# Altium schematic sheet MOSFETs.SchDoc
size B; SheetNumber: 2; SheetTotal: 4
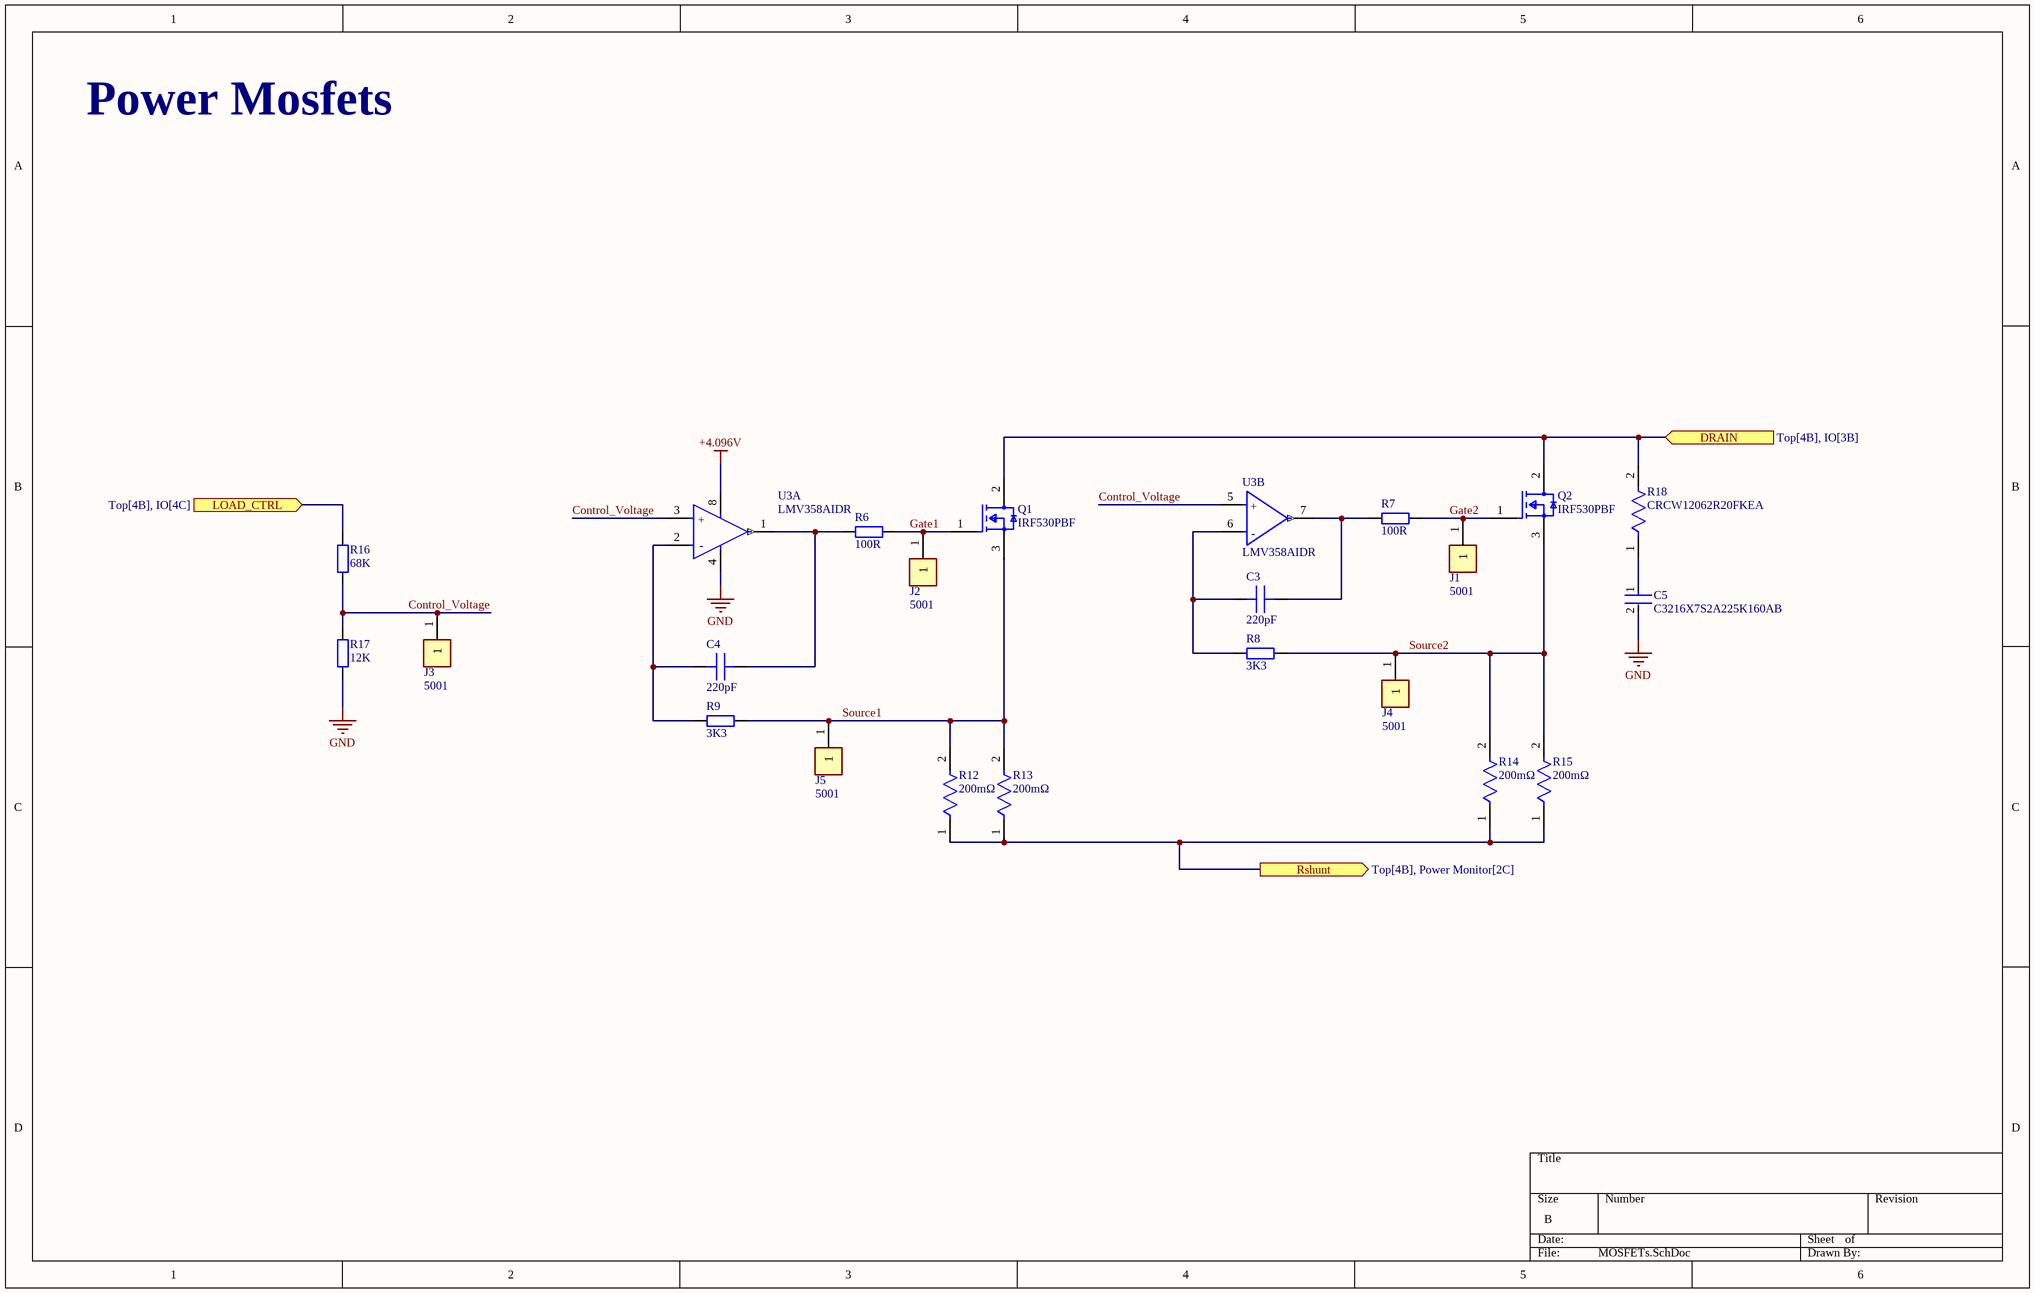
[diagram p0: MOSFETs.SchDoc]

## Parts
C3  220pF  [IPC C C0603 NO SILK]
C4  220pF  [IPC C C0603 NO SILK]
C5  C3216X7S2A225K160AB  [FP-C3216-160-0_2-IPC_B]
J1  5001  [FP-5001-MFG]
J2  5001  [FP-5001-MFG]
J3  5001  [FP-5001-MFG]
J4  5001  [FP-5001-MFG]
J5  5001  [FP-5001-MFG]
Q1  IRF530PBF  [FP-X15-0364-MFG]
Q2  IRF530PBF  [FP-X15-0364-MFG]
R6  100R  [IPC C R0603 NO SILK]
R7  100R  [IPC C R0603 NO SILK]
R8  3K3  [IPC C R0603 NO SILK]
R9  3K3  [IPC C R0603 NO SILK]
R12  200mΩ  [FP-RL2512-MFG]
R13  200mΩ  [FP-RL2512-MFG]
R14  200mΩ  [FP-RL2512-MFG]
R15  200mΩ  [FP-RL2512-MFG]
R16  68K  [IPC C R0603 NO SILK]
R17  12K  [IPC C R0603 NO SILK]
R18  CRCW12062R20FKEA  [FP-CRCW1206-e3-IPC_A]
U3  LMV358AIDR  [FP-D0008A-IPC_C]  (parts A,B of 2)

## Ports
DRAIN (in, see Top[4B], IO[3B]), LOAD_CTRL (in, see Top[4B], IO[4C]), Rshunt (out, see Top[4B], Power Monitor[2C])

## Nets
+4.096V: U3.8(V+)
GND: C5.2 R17.1 U3.4(V-)
Control_Voltage: J3.1 R16.1 R17.2 U3.3(+IN_A) U3.5(+IN_B)
DRAIN: Q1.2(D) Q2.2(D) R18.2 ; port DRAIN
Gate1: J2.1 Q1.1(G) R6.2
Gate2: J1.1 Q2.1(G) R7.2
LOAD_CTRL: R16.2 ; port LOAD_CTRL
Rshunt: R12.1 R13.1 R14.1 R15.1 ; port Rshunt
Source1: J5.1 Q1.3(S) R9.2 R12.2 R13.2
Source2: J4.1 Q2.3(S) R8.2 R14.2 R15.2
NetC3_1: C3.1 R8.1 U3.6(-IN_B)
NetC3_2: C3.2 R7.1 U3.7(OUT_B)
NetC4_1: C4.1 R9.1 U3.2(-IN_A)
NetC4_2: C4.2 R6.1 U3.1(OUT_A)
NetC5_1: C5.1 R18.1

## Notes on the sheet
- Power Mosfets
- (in symbol CMP-04895-000233-1, part A) +; -
- (in symbol CMP-04895-000233-1, part B) +; -

## Library data of the parts
C3 C4 = CMP-002-000001-1: Generic CAP 0603; Value: 220pF; Source: Schlib1.SchLib; Design Item ID: Generic CAP 0603
C5 = CMP-08246-004303-1: Multilayer Ceramic Capacitors 2.2uF ±10% 100V X7S SMD 1206; Min Operating Temperature: -55°C; Tolerance: 10%; Number of Pins: 2; Case Code (Metric): 3216; REACH SVHC: No SVHC; Package Quantity: 1; Capacitance: 2.2uF; Lead Free: Lead Free; Termination: SMD/SMT; Voltage Rating (DC): 100V; Voltage Rating: 100V; Case Code (Imperial): 1206; Dielectric: X7S; Height: 1.6mm; Packaging: Tape and Reel; Weight: 0.000571oz; Radiation Hardening: No; Mount: Surface Mount; Width: 0.063inch; Length: 3.2mm; Case/Package: 1206; Depth: 1.6mm; RoHS Compliant: Yes; Max Operating Temperature: 125°C; Series: C; Voltage: 100V; Resistor Type: Ceramic; Thickness: 0.071inch; Construction: Flat
J1-J5 = CMP-2000-05181-2: PC TEST POINT MINIATURE BLACK; Body Material: Bronze; Plating: Silver; Inside Diameter: 1.27mm; Hole Diameter: 1.6mm; Number of Ports: 1; Outside Diameter: 2.54mm; Insulation: Insulated; Insulation Material: Nylon; Mount: Through Hole; RoHS Compliant: Yes; Series: THM; Height: 0.3inch; Termination: Through Hole; Material: Nylon; Packaging: Bulk; Contact Material: Bronze; REACH SVHC: No SVHC; Contact Plating: Silver; Orientation: Straight; Lead Free: Lead Free; Package Quantity: 100; Length: 7.62mm; Flammability Rating: UL94 V-0; Number of Contacts: 1; Diameter: 2.54mm; Housing Color: Black; Color: Black
Q1 Q2 = CMP-02550-000190-1: MOSFET N-CH 100V 14A TO-220AB; Manufacturer: Vishay; Reverse Recovery Charge: 850nC; Rthja Max: 62°C/W; Power Dissipation: 88W; Depletion Mode: False; Input Capacitace At Vds: 670pF @ 25V; Pulse Drain Current: 56A; Turn On Delay Time: 10ns; Drain To Source Resistance: 0.16Ω; Number Of N Channels: 1; Max Junction Temp: +175°C; Threshold Vgs Max: 4V; Standoff Height: 3.33mm; Max Forward Diode Voltage: 2.5V; Turn Off Delay Time: 23ns; Gate To Source Voltage: 20V; Threshold Vgs Min: 2V; Reverse Recovery Time: 150ns; Gate Charge At Vgs: 26nC @ 10V; Temperature: -55°C to +175°C; Drain To Source Voltage: 100V; Mouser Description: MOSFET N-Chan 100V 14 Amp; Device Class L2: Transistors; Temperature Range High: +175°C; ComponentLink2URL: http://www.vishay.com/docs/91019/91019.pdf; Lead Free: Yes; Height: 19.89mm; Octopart: https://octopart.com/irf530pbf-vishay-46547999; Category: Trans; ComponentLink2Description: Datasheet; RoHS: TRUE; Device Class L3: MOSFETs; Automotive: No; Device Class L1: Discrete Semiconductors; Package: X15-0364; Manufacturer Part Number: IRF530PBF; Continuous Drain Current: 14A; Digikey Description: MOSFET N-CH 100V 14A TO-220AB; Number Of Channels: 1; Drain To Source Breakdown Voltage: 100V; Temperature Range Low: -55°C
R6-R9 R16 R17 = CMP-008-000001-2: Generic RES 0603; Design Item ID: Generic RES 0603; Source: Schlib1.SchLib
  R6 R7: Value: 100R
  R8 R9: Value: 3K3
  R16: Value: 68K
  R17: Value: 12K
R12-R15 = CMP-03412-002864-1: RES 0.2 OHM 1% 1W 2512 / RL2512FK-070R2L; Manufacturer: Yageo; Temperature Coefficient: 600ppm/°C; Automotive Grade: Grade 0; Category: Res; Manufacturer Part Number: RL2512FK-070R2L; Series: RL; Automotive: Yes; ComponentLink2Description: Datasheet; RoHS: TRUE; Tolerance: 1%; Value: 200mΩ; Octopart: https://octopart.com/rl2512fk-070r2l-yageo-22252310; Power Rating: 1W; Package: RL2512; ComponentLink2URL: http://www.yageo.com/documents/recent/PYu-RL_Group_521_RoHS_L_2.pdf; Footprint Url: http://www.yageo.com/exep/pages/download/literatures/PYu-R_Mount_10.pdf; Ipc Land Pattern Name: RESC635320X55; Device Class L1: Passive Components; Temperature: -55°C to +155°C; Mouser Description: Res Thick Film 2512 0.2 Ohm 1% 1W ±600ppm/C Epoxy Pad SMD Automotive T/R; Height: 0.65mm; Temperature Range High: +155°C; Digikey Description: RES 0.2 OHM 1% 1W 2512; Temperature Range Low: -55°C; Composition: Thick Film; Resistance: 200mΩ; Lead Free: Yes; Device Class L3: Chip SMD Resistors; Device Class L2: Resistors
R18 = CMP-2003-02449-2: RES Thick Film, 2.2Ω, 1%, 0.25W, 100ppm/°C, 1206; Voltage Rating (DC): 200V; Resistance: 2.2R; Max Power Dissipation: 250mW; Features: Automotive AEC-Q200; Number of Terminations: 2; Depth: 1.6mm; Width: 0.063inch; Case Code (Metric): 3216; Packaging: Tape and Reel; Power Rating: 250mW; Voltage Rating: 200V; Temperature Coefficient: 100ppm/°C; Package Quantity: 10; Contact Plating: Tin; Military Standard: Not; Lead Free: Lead Free; Composition: Thick Film; Case/Package: 1206; Height: 0.55mm; Max Operating Temperature: 155°C; Length: 3.2mm; Number of Pins: 2; Radiation Hardening: No; Case Code (Imperial): 1206; Tolerance: 1%; Termination: SMD/SMT; Weight: 0.000353oz; Min Operating Temperature: -55°C
U3 = CMP-04895-000233-1: IC OPAMP GP 2 CIRCUIT 8SOIC; Gain Bandwidth Product: 1MHz; Number of Channels: 2; Input Offset Voltage (Vos): 1mV; Operating Supply Current: 80uA; Input Bias Current: 10pA; Slew Rate: 1.7V/µs; Min Operating Temperature: -40°C; Number of Circuits: 2; Packaging: Cut Tape; Case/Package: SOIC; RoHS Compliant: Yes; Number of Pins: 8; Mount: Surface Mount; Max Operating Temperature: 125°C